# Altium schematic sheet U_ADCS_Isolated.SchDoc
size A4; SheetNumber: 6; SheetTotal: 9
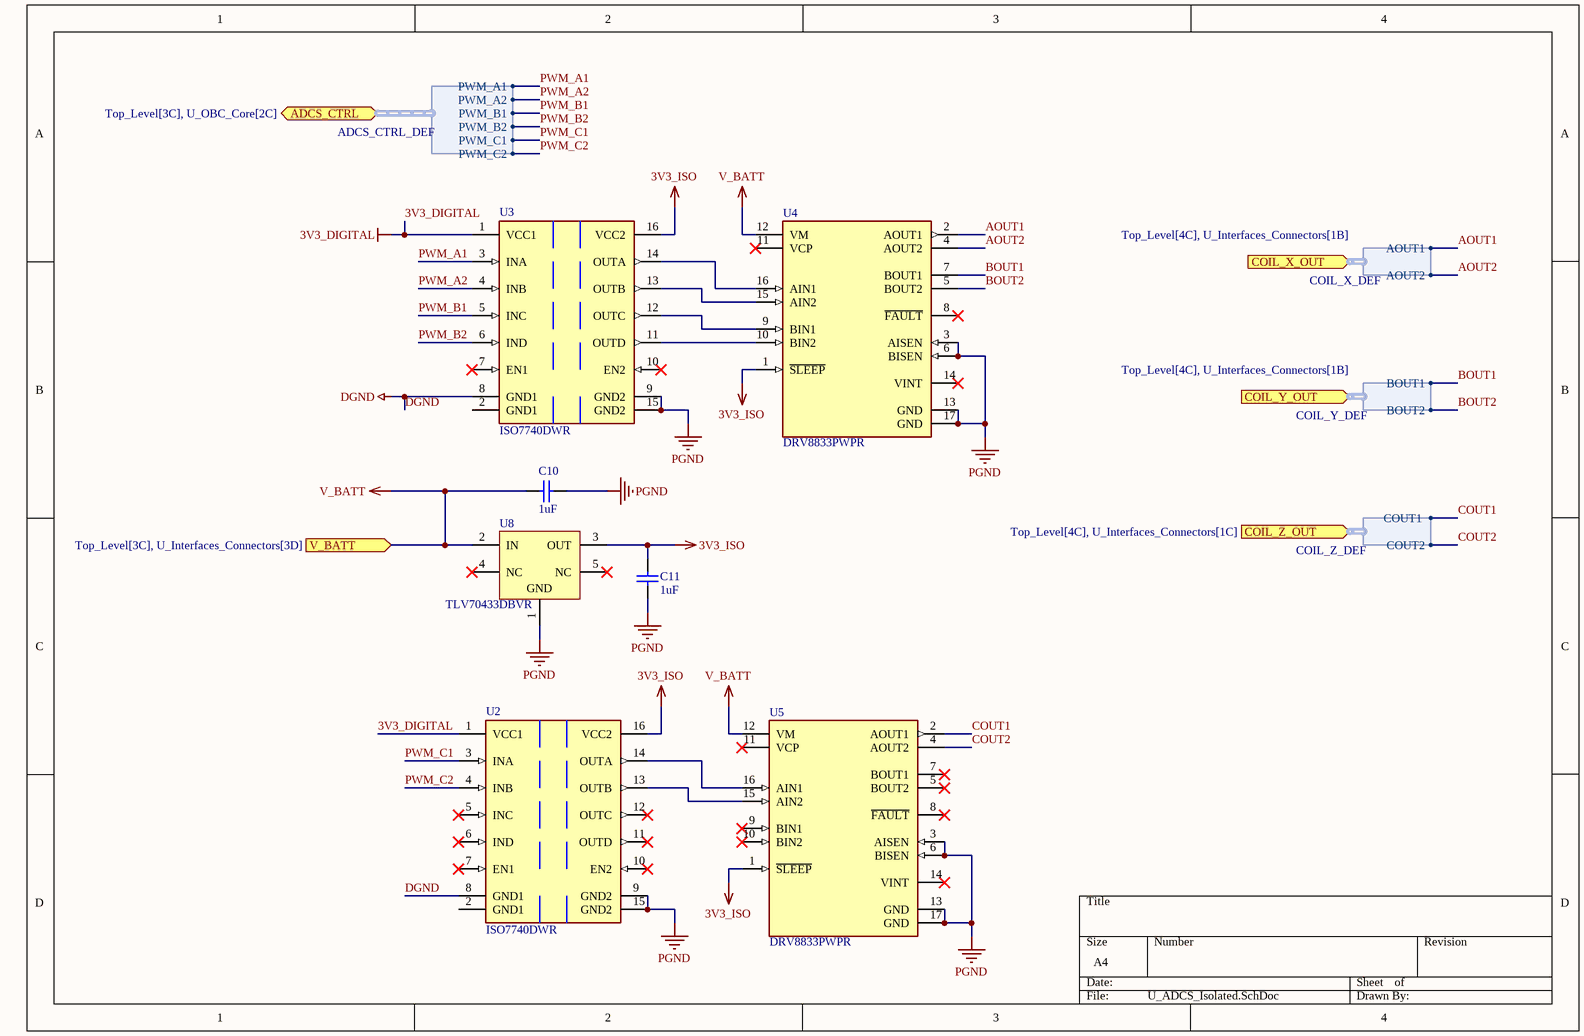
[diagram p0: U_ADCS_Isolated.SchDoc]

## Parts
C10  1uF  [CAPC2013X140X50NL20T25]
C11  1uF  [CAPC2013X140X50NL20T25]
U2  ISO7740DWR  [FP-DW0016B-MFG]
U3  ISO7740DWR  [FP-DW0016B-MFG]
U4  DRV8833PWPR  [FP-PWP0016C-IPC_A]
U5  DRV8833PWPR  [FP-PWP0016C-IPC_A]
U8  TLV70433DBVR  [DBV0005A_M]

## Ports
ADCS_CTRL (bidir, harness ADCS_CTRL_DEF, see Top_Level[3C], U_OBC_Core[2C]), COIL_X_OUT (in, harness COIL_X_DEF, see Top_Level[4C], U_Interfaces_Connectors[1B]), COIL_Y_OUT (in, harness COIL_Y_DEF, see Top_Level[4C], U_Interfaces_Connectors[1B]), COIL_Z_OUT (in, harness COIL_Z_DEF, see Top_Level[4C], U_Interfaces_Connectors[1C]), V_BATT (in, see Top_Level[3C], U_Interfaces_Connectors[3D])

## Harnesses
ADCS_CTRL_DEF: PWM_A1, PWM_A2, PWM_B1, PWM_B2, PWM_C1, PWM_C2
COIL_X_DEF: AOUT1, AOUT2
COIL_Y_DEF: BOUT1, BOUT2
COIL_Z_DEF: COUT1 , COUT2

## Nets
3V3_DIGITAL: U2.1(VCC1) U3.1(VCC1)
3V3_ISO: C11.2 U2.16(VCC2) U3.16(VCC2) U4.1(~{SLEEP}) U5.1(~{SLEEP}) U8.3(OUT)
DGND: U2.8(GND1) U3.8(GND1)
PGND: C10.2 C11.1 U2.9(GND2) U2.15(GND2) U3.9(GND2) U3.15(GND2) U4.3(AISEN) U4.6(BISEN) U4.13(GND) U4.17(GND) U5.3(AISEN) U5.6(BISEN) U5.13(GND) U5.17(GND) U8.1(GND)
V_BATT: C10.1 U4.12(VM) U5.12(VM) U8.2(IN) ; port V_BATT
AOUT1: U4.2(AOUT1) ; port COIL_X_OUT.AOUT1
AOUT2: U4.4(AOUT2) ; port COIL_X_OUT.AOUT2
BOUT1: U4.7(BOUT1) ; port COIL_Y_OUT.BOUT1
BOUT2: U4.5(BOUT2) ; port COIL_Y_OUT.BOUT2
COUT1: U5.2(AOUT1) ; port COIL_Z_OUT.COUT1 
COUT2: U5.4(AOUT2) ; port COIL_Z_OUT.COUT2
PWM_A1: U3.3(INA) ; port ADCS_CTRL.PWM_A1
PWM_A2: U3.4(INB) ; port ADCS_CTRL.PWM_A2
PWM_B1: U3.5(INC) ; port ADCS_CTRL.PWM_B1
PWM_B2: U3.6(IND) ; port ADCS_CTRL.PWM_B2
PWM_C1 : U2.3(INA) ; port ADCS_CTRL.PWM_C1
PWM_C2: U2.4(INB) ; port ADCS_CTRL.PWM_C2
NetU2_13: U2.13(OUTB) U5.15(AIN2)
NetU2_14: U2.14(OUTA) U5.16(AIN1)
NetU3_11: U3.11(OUTD) U4.10(BIN2)
NetU3_12: U3.12(OUTC) U4.9(BIN1)
NetU3_13: U3.13(OUTB) U4.15(AIN2)
NetU3_14: U3.14(OUTA) U4.16(AIN1)

Not connected (* = marked no-connect by the designer): U2 2(GND1) 5(INC)* 6(IND)* 7(EN1)* 10(EN2)* 11(OUTD)* 12(OUTC)*; U3 2(GND1) 7(EN1)* 10(EN2)*; U4 8(~{FAULT})* 11(VCP)* 14(VINT)*; U5 5(BOUT2)* 7(BOUT1)* 8(~{FAULT})* 9(BIN1)* 10(BIN2)* 11(VCP)* 14(VINT)*; U8 4(NC)* 5(NC)*

## Library data of the parts
C10 C11 = CMP-2007-04663-1: Part Number: 0805YD105MAT2A; Manufacturer: AVX Interconnect / Elco
U2 U3 = CMP-04872-000013-1: DGTL ISO 5KV 4CH GEN PURP 16SOIC; Manufacturer Part Number: ISO7741DWR; Manufacturer: Texas Instruments; Nominal Supply Current: 1.5-18mA; Standoff Height: 0.1mm; Min Supply Voltage: 2.25V; Max Supply Voltage: 5.5V; Max Junction Temp: +150°C; ComponentLink2Description: Datasheet; Temperature Range Low: -55°C; Device Class L2: Interface ICs; Package: DW0016B; Temperature: -55°C to +125°C; Mouser Description: High-speed, low-power, robust EMC quad-channel digital isolator 16-SOIC -55 to 125; Octopart: https://octopart.com/iso7741dwr-texas+instruments-71651905; RoHS: TRUE; Category: IC; Ambient Temperature Range Low: -55°C; Height: 2.65mm; Device Class L3: unset; Device Class L1: Integrated Circuits (ICs); Digikey Description: DGTL ISO 5KV 4CH GEN PURP 16SOIC; Automotive: No; Temperature Range High: +125°C; Ambient Temperature Range High: +125°C; Lead Free: Yes; ComponentLink2URL: http://www.ti.com/lit/ds/symlink/iso7741.pdf; Ipc Land Pattern Name: SOIC127P1030X265-16
U4 U5 = CMP-1529-00004-3: IC MOTOR DRIVER PAR 16HTSSOP; Supply Current: 3mA; Max Output Current: 2A; Interface: PWM; Output Current: 1.5A; Max Supply Voltage: 10.8V; Fault Protection: Over Temperature; Number of Outputs: 2; Min Supply Voltage: 2.7V; Nominal Supply Current: 3mA; Series: DRV8833; Min Operating Temperature: -40°C; Package Quantity: 2000; Packaging: Tape and Reel; Case/Package: HTSSOP; Output Current per Channel: 1.5A; RoHS Compliant: Yes; RMS Current (Irms): 1.5A; Max Operating Temperature: 85°C; Technology: NMOS; Number of Pins: 16; Radiation Hardening: No; Lead Free: Lead Free; REACH SVHC: No SVHC
U8 = CMP-0394-00651-2: Single Output LDO, 150 mA, Fixed 3.3 V Output, 2.5 to 24 V Input, with Ultra-Low IQ, 5-pin SOT-23 (DBV), -40 to 125 degC, Green (RoHS & no Sb/Br); Manufacturer: Texas Instruments; Vdo(Typ)(mV): 400; Accuracy(%): 2; Vin(Min)(V): 2.5; Vin(Max)(V): 24; SubFamily: Single Channel LDO; Iq(Typ)(mA): 0.003; Fixed Output Options(V): 3.3; Iout(Max)(A): 0.15; DatasheetVersion: SBVS148C; ComponentLink1URL: http://www.ti.com/; ComponentLink3URL: http://www.ti.com/litv/pdf/mpds018i; Code_JEDEC: MO-178; PackageReference: DBV0005A; PackageDescription: 5-Pin Plastic Small Outline, Body 1.60 Ãƒâ€” 2.90 mm, Pitch 0.95 mm; Mounting Technology: Surface Mount; ComponentLink1Description: Manufacturer URL; Vout Adj(Min)(V): 3.3; PartNumber: TLV70433DBVR; ComponentLink2Description: Datasheet; PackageVersion: 4073253-4/K; ComponentLink2URL: http://www.ti.com/general/docs/lit/getliterature.tsp?genericPartNumber=TLV70433&fileType=pdf; ComponentLink3Description: Package Specification; Vout Adj(Max)(V): 3.3; Eco-Plan: Green (RoHS & no Sb/Br)